# EAGLE schematic Elements Schematic (EAGLE 9.6.2)
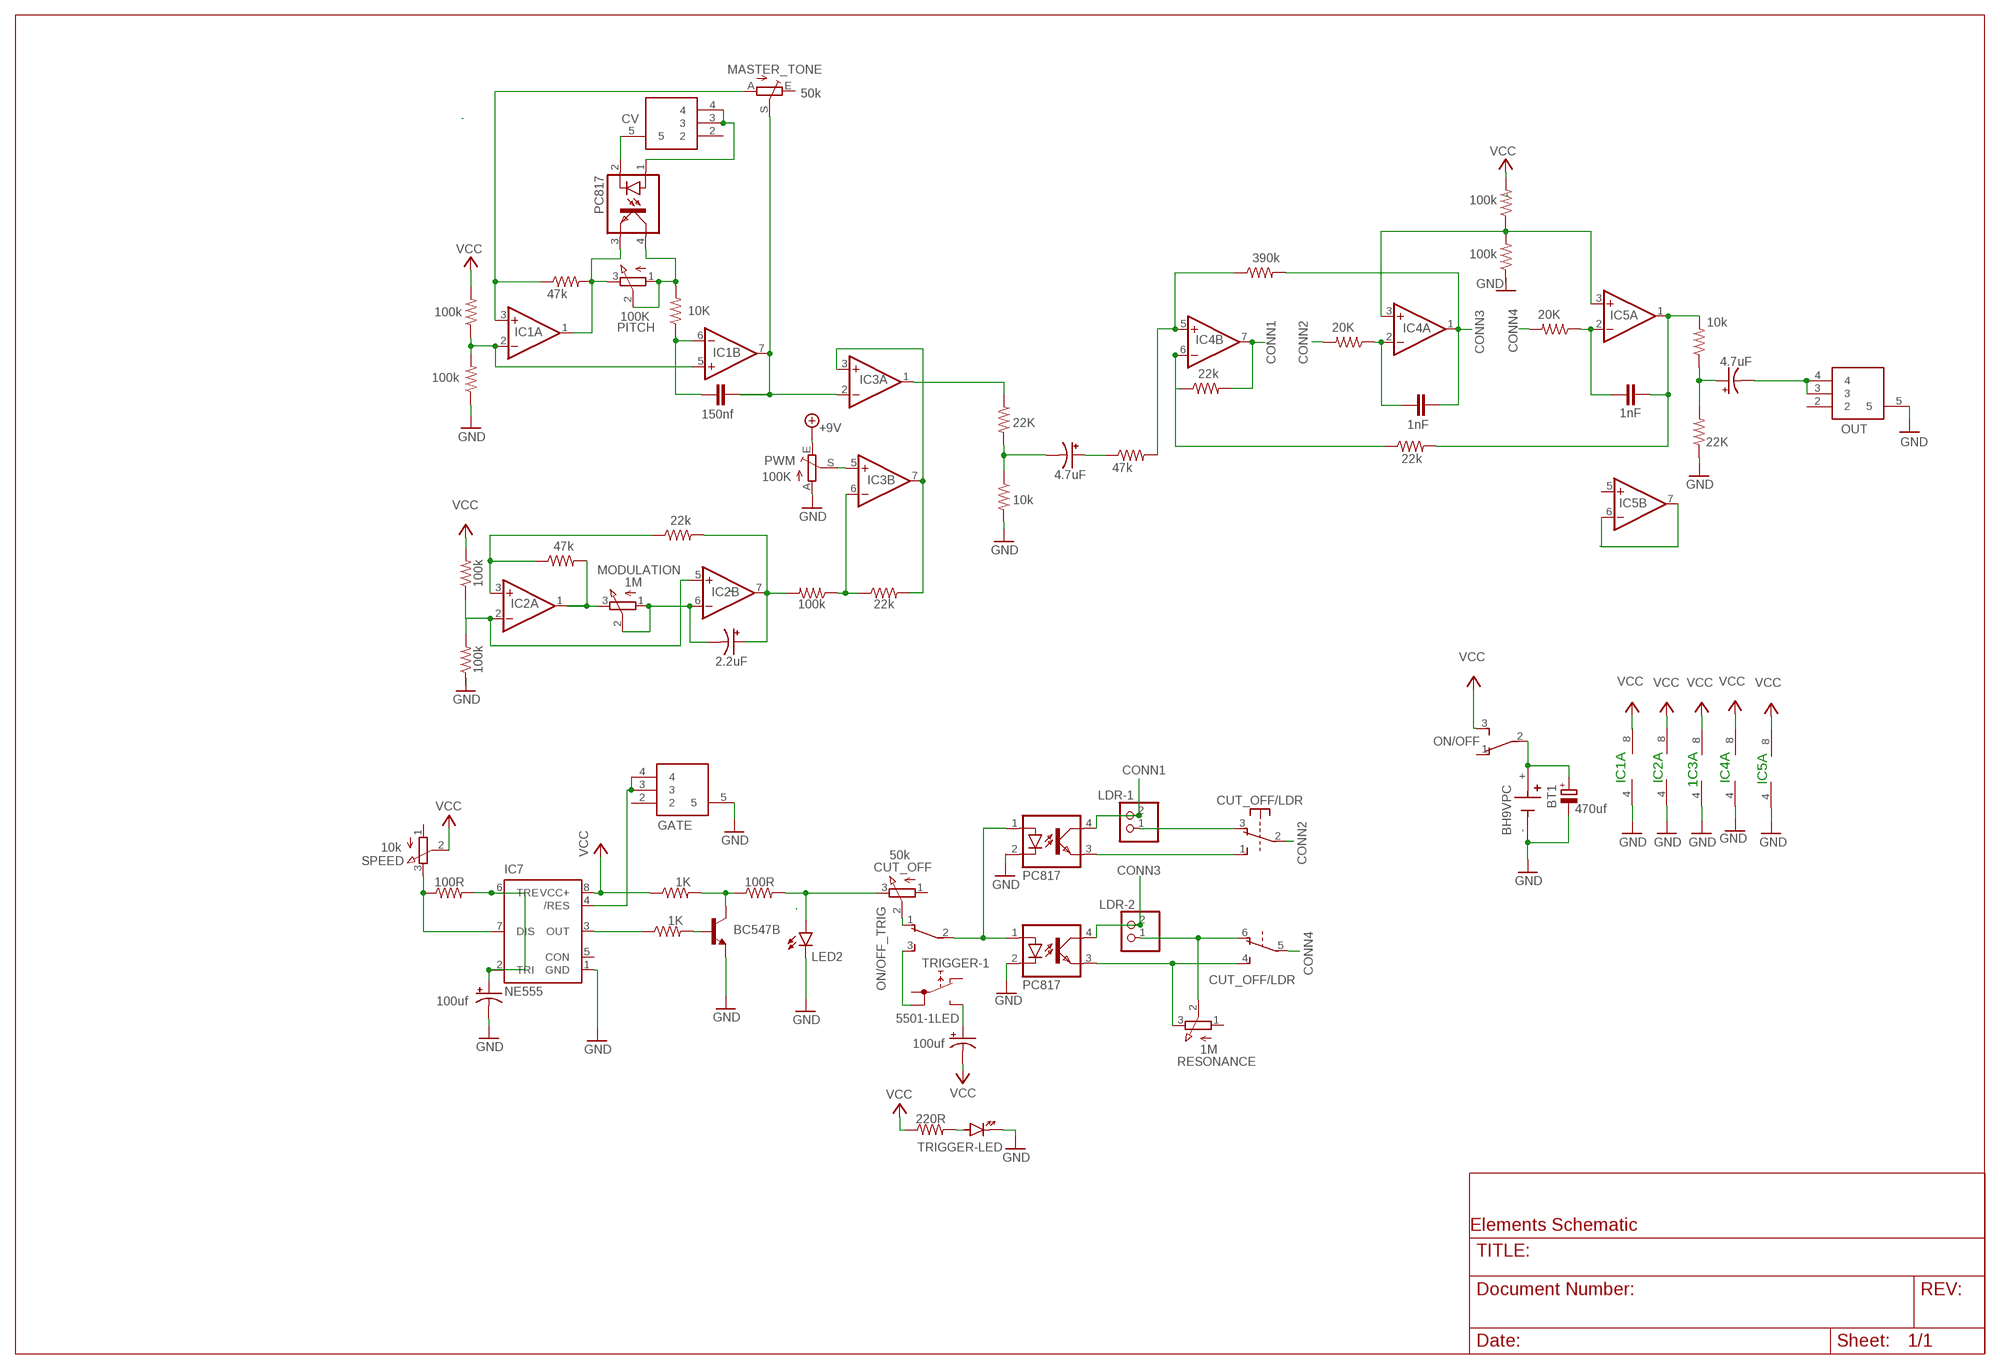
[diagram p0: schematic, sheet 1]

## Parts
BT1  BH9VPC  [BAT_BH9VPC]
C1  150nf  C-EU050-024X044  [C050-024X044]
C2  2.2uF  CPOL-USE2.5-5  [E2,5-5]
C3  4.7uF  CPOL-USE2.5-5  [E2,5-5]
C4  1nF  C-EU050-024X044  [C050-024X044]
C5  1nF  C-EU050-024X044  [C050-024X044]
C6  4.7uF  CPOL-USE2.5-5  [E2,5-5]
C7  100uf  CPOL-USE2.5-5  [E2,5-5]
C8  470uf  CPOL-EUE3.5-8  [E3,5-8]
C11  100uf  CPOL-USE2.5-5  [E2,5-5]
CUT_OFF  50k  EVUF2A  [EVUF]
CUT_OFF/LDR  SWITCH-6PIN  [SWITCH-6PIN]
CV  PJ-320A  [PJ320A]
GATE  PJ-320A  [PJ320A]
IC1  LM358N  [DIL08]
IC2  LM358N  [DIL08]
IC3  LM358N  [DIL08]
IC4  LM358N  [DIL08]
IC5  LM358N  [DIL08]
IC7  NE555  [DIL-08]
LDR-1  PINHD-1X2  [1X02]
LDR-2  PINHD-1X2  [1X02]
LED2  LED3MM  [LED3MM]
MASTER_TONE  50k  TRIM_EU-B25P  [B25P]
MODULATION  1M  EVUF2A  [EVUF]
OK1  PC817  [DIL04]
OK2  PC817  [DIL04]
OK3  PC817  [DIL04]
ON/OFF  TL36PO  [TL3XPO]
ON/OFF_TRIG  TL36PO  [TL3XPO]
OUT  PJ-320A  [PJ320A]
PITCH  100K  EVUF2A  [EVUF]
PWM  100K  TRIM_EU-B25P  [B25P]
Q1  BC547B  [TO92]
R1  100k  R-US_0207/10  [0207/10]
R2  100k  R-US_0207/10  [0207/10]
R3  100k  R-US_0207/10  [0207/10]
R4  100k  R-US_0207/10  [0207/10]
R5  47k  R-US_0207/10  [0207/10]
R6  20K  R-US_0207/10  [0207/10]
R7  100k  R-US_0207/10  [0207/10]
R8  22k  R-US_0207/10  [0207/10]
R9  10k  R-US_0207/10  [0207/10]
R10  10k  R-US_0207/10  [0207/10]
R11  22K  R-US_0207/10  [0207/10]
R12  47k  R-US_0207/10  [0207/10]
R13  22k  R-US_0207/10  [0207/10]
R14  390k  R-US_0207/10  [0207/10]
R15  100k  R-US_0207/10  [0207/10]
R16  47k  R-US_0207/10  [0207/10]
R17  22K  R-US_0207/10  [0207/10]
R18  22k  R-US_0207/10  [0207/10]
R19  100k  R-US_0207/10  [0207/10]
R20  20K  R-US_0207/10  [0207/10]
R21  22k  R-US_0207/10  [0207/10]
R22  10K  R-US_0207/10  [0207/10]
R23  220R  R-US_0207/10  [0207/10]
R38  100R  R-US_0207/10  [0207/10]
R39  1K  R-US_0207/10  [0207/10]
R40  100R  R-US_0207/10  [0207/10]
R41  1K  R-US_0207/10  [0207/10]
RESONANCE  1M  EVUF2A  [EVUF]
SPEED  10k  EVUF2A  [EVUF]
TRIGGER  5501-1LED  [5501-1LED]

## Nets
CONN1: IC4.7(B:OUT) LDR-1.2 OK1.4(COL) R13.2
CONN2: CUT_OFF/LDR.2(1:P) R6.2
CONN3: C4.2 IC4.1(A:OUT) LDR-2.2 OK3.4(COL) R14.2
CONN4: CUT_OFF/LDR.5(2:P) R20.2
GND: BT1.- C8.- C11.- GATE.5 IC1.4(P:V-) IC2.4(P:V-) IC3.4(P:V-) IC4.4(P:V-) IC5.4(P:V-) IC7.1(GND) LED2.K(C) OK1.2(C) OK3.2(C) OUT.5 PWM.A Q1.1(E) R2.1 R3.1 R10.2 R17.1 R19.1 TRIGGER.-(-LED:K)
N$1: IC1.3(A:+IN) MASTER_TONE.A R5.1
N$2: C1.1 IC1.6(B:-IN) R22.1
N$3: IC1.2(A:-IN) IC1.5(B:+IN) R1.1 R2.2
N$4: C1.2 IC1.7(B:OUT) IC3.2(A:-IN) MASTER_TONE.S
N$5: CUT_OFF.2(S) ON/OFF_TRIG.1(O)
N$6: IC2.2(A:-IN) IC2.5(B:+IN) R3.2 R4.1
N$7: IC2.3(A:+IN) R16.1 R18.1
N$8: IC2.1(A:OUT) MODULATION.3(E) R16.2
N$10: C2.- IC2.6(B:-IN) MODULATION.1(A) MODULATION.2(S)
N$11: C2.+ IC2.7(B:OUT) R7.2 R18.2
N$12: IC3.6(B:-IN) R7.1 R8.1
N$13: IC3.3(A:+IN) IC3.7(B:OUT) R8.2
N$14: IC3.5(B:+IN) PWM.S
N$15: IC3.1(A:OUT) R11.1
N$16: C6.+ R9.1 R17.2
N$17: C3.+ R12.1
N$18: IC4.5(B:+IN) R12.2 R14.1
N$19: IC4.6(B:-IN) R13.1 R21.1
N$21: C6.- OUT.3 OUT.4
N$22: C5.2 IC5.1(A:OUT) R9.2 R21.2
N$23: C4.1 IC4.2(A:-IN) R6.1
N$24: IC4.3(A:+IN) IC5.3(A:+IN) R15.1 R19.2
N$26: C3.- R10.1 R11.2
N$27: C5.1 IC5.2(A:-IN) R20.1
N$28: OK2.4(COL) PITCH.1(A) PITCH.2(S) R22.2
N$29: IC5.6(B:-IN) IC5.7(B:OUT)
N$30: CV.5 OK2.2(C)
N$31: CV.3 CV.4 OK2.1(A)
N$32: ON/OFF_TRIG.3(S) TRIGGER.1B(-1:1B)
N$33: C7.+ TRIGGER.NO(-1:NO)
N$34: R23.2 TRIGGER.+(-LED:A)
N$38: OK1.1(A) OK3.1(A) ON/OFF_TRIG.2(P)
N$41: GATE.3 GATE.4 IC7.4(/RES)
N$42: BT1.+ C8.+ ON/OFF.2(P)
N$50: IC1.1(A:OUT) OK2.3(EMIT) PITCH.3(E) R5.2
N$54: CUT_OFF.3(E) LED2.A R40.2
N$56: CUT_OFF/LDR.3(1:O) LDR-1.1
N$57: CUT_OFF/LDR.1(1:S) OK1.3(EMIT)
N$58: CUT_OFF/LDR.6(2:O) LDR-2.1 RESONANCE.2(S)
N$59: CUT_OFF/LDR.4(2:S) OK3.3(EMIT) RESONANCE.3(E)
N$60: C11.+ IC7.2(TRI) IC7.6(TRE) R38.2
N$61: IC7.7(DIS) R38.1 SPEED.3(E)
N$62: Q1.3(C) R40.1 R41.2
N$63: IC7.3(OUT) R39.1
N$64: Q1.2(B) R39.2
VCC: C7.- IC1.8(P:V+) IC2.8(P:V+) IC3.8(P:V+) IC4.8(P:V+) IC5.8(P:V+) IC7.8(VCC+) ON/OFF.3(S) PWM.E R1.2 R4.2 R15.2 R23.1 R41.1 SPEED.2(S) ; supply symbol labelled +9V
Unconnected: CUT_OFF.1(A) CV.2 GATE.2 IC5.5(B:+IN) IC7.5(CON) MASTER_TONE.E ON/OFF.1(O) OUT.2 RESONANCE.1(A) SPEED.1(A) TRIGGER.1A(-1:1A) TRIGGER.NC(-1:NC)

## Notes on the sheet
- IC1A | IC2A | 1C3A | IC4A | IC5A

## Library data of the parts
BT1 = BH9VPC-no holes:BH9VPC: 9V Battery Holder Check prices <https://pricing.snapeda.com/parts/BH9VPC/MPD%20%28Memory%20Protection%20Devices%29/view-part?ref=eda>; AVAILABILITY: Warning; DESCRIPTION: BATTERY HOLDER 9V PC PIN; MF: MPD (Memory Protection Devices); MP: BH9VPC; PACKAGE: None; PRICE: None; PURCHASE-URL: https://pricing.snapeda.com/search/part/BH9VPC/?ref=eda
C1 C4 C5 = rcl:C-EU: CAPACITOR, European symbol; SPICEPREFIX: C
C2 C3 C6 C7 C11 = rcl:CPOL-US: POLARIZED CAPACITOR, American symbol; SPICEPREFIX: C
C8 = rcl:CPOL-EU: POLARIZED CAPACITOR, European symbol; SPICEPREFIX: C
CUT_OFF MODULATION PITCH RESONANCE SPEED = pot:EVU: 9 mm Square Rotary Potentiometers Source: Panasonic
CUT_OFF/LDR = My Library:SWITCH-6PIN: ITT SWITCH
CV GATE OUT = PJ-320A:PJ-320A: 3.5 mm Audio Jack Connector PCB Mount Female Socket 4 Pin PJ-320A Source: Datasheet <http://www.helloxkb.com/public/images/pdf/PJ-320A-.pdf>; DESCRIPTION: 3.5 mm Audio Jack Connector PCB Mount Female Socket 4 Pin PJ-320A; HEIGHT: 5.3mm; MANUFACTURER_NAME: XKB Connectivity; MANUFACTURER_PART_NUMBER: PJ-320A
IC1-IC5 = linear:LM358: OP AMP also LM158; LM258; LM2904 Source: http://cache.national.com/ds/LM/LM158.pdf
IC7 = st-microelectronics:NE555: General purpose bipolar Timer; MF: Arrow Electronics; MPN: NE555N; OC_FARNELL: 1467742; OC_NEWARK: 89K1486
LDR-1 LDR-2 = pinhead:PINHD-1X2: PIN HEADER
LED2 = led:LED: LED OSRAM: - CHIPLED LG R971, LG N971, LY N971, LG Q971, LY Q971, LO R971, LY R971 LH N974, LH R974 LS Q976, LO Q976, LY Q976 LO Q996 - Hyper CHIPLED LW Q18S LB Q993, LB Q99A, LB R99A - SideLED LS A670, LO A670, LY A670, LG A670, LP A670 LB A673, LV A673, LT A673, LW A673 LH A674 LY A675 LS A676, LA A676, LO A676, LY A676, LW A676 LS A679, LY A679, LG A679 - Hyper Micro SIDELED® LS Y876, LA Y876, LO Y876, LY Y876 LT Y87S - SmartLED LW L88C, LW L88S LB L89C, LB L89S, LG L890 LS L89K, LO L89K, LY L89K LS L896, LA L896, LO L896, LY L896 - TOPLED LS T670, LO T670, LY T670, LG T670, LP T670 LSG T670, LSP T670, LSY T670, LOP T670, LYG T670 LG T671, LOG T671, LSG T671 LB T673, LV T673, LT T673, LW T673 LH T674 LS T676, LA T676, LO T676, LY T676, LB T676, LH T676, LSB T676, LW T676 LB T67C, LV T67C, LT T67C, LS T67K, LO T67K, LY T67K, LW E67C LS E67B, LA E67B, LO E67B, LY E67B, LB E67C, LV E67C, LT E67C LW T67C LS T679, LY T679, LG T679 LS T770, LO T770, LY T770, LG T770, LP T770 LB T773, LV T773, LT T773, LW T773 LH T774 LS E675, LA E675, LY E675, LS T675 LS T776, LA T776, LO T776, LY T776, LB T776 LHGB T686 LT T68C, LB T68C - Hyper Mini TOPLED® LB M676 - Mini TOPLED Santana® LG M470 LS M47K, LO M47K, LY M47K Source: http://www.osram.convergy.de LUXEON: - LUMILED® LXK2-PW12-R00, LXK2-PW12-S00, LXK2-PW14-U00, LXK2-PW14-V00 LXK2-PM12-R00, LXK2-PM12-S00, LXK2-PM14-U00 LXK2-PE12-Q00, LXK2-PE12-R00, LXK2-PE12-S00, LXK2-PE14-T00, LXK2-PE14-U00 LXK2-PB12-K00, LXK2-PB12-L00, LXK2-PB12-M00, LXK2-PB14-N00, LXK2-PB14-P00, LXK2-PB14-Q00 LXK2-PR12-L00, LXK2-PR12-M00, LXK2-PR14-Q00, LXK2-PR14-R00 LXK2-PD12-Q00, LXK2-PD12-R00, LXK2-PD12-S00 LXK2-PH12-R00, LXK2-PH12-S00 LXK2-PL12-P00, LXK2-PL12-Q00, LXK2-PL12-R00 Source: www.luxeon.com KINGBRIGHT: KA-3528ASYC Source: www.kingbright.com
MASTER_TONE PWM = pot:TRIM_EU-: POTENTIOMETER
OK1-OK3 = optocoupler:PC817: SHARP OPTO COUPLER; MPN: PC817X4J000F; OC_FARNELL: 9707727; OC_NEWARK: 97K7059
ON/OFF ON/OFF_TRIG = switch:TL36PO: TINY SWITCH ON - ON Source: http://www2.produktinfo.conrad.com/datenblaetter/700000-724999/705152-da-01-de-Subminiaturschalter_TL_36YO.pdf
Q1 = transistor-npn:BC547*: NPN Transistor
R1-R23 R38-R41 = rcl:R-US_: RESISTOR, American symbol; SPICEPREFIX: R
TRIGGER = switch:55?-1LED: PUSHBUTTON SERIES 5500 SWITCHES 1 LED Source: www.e-switch.com .. 5500.pdf